# Altium schematic sheet NanoD1_Clk_Reset.SchDoc
size 420 x 297 mm; SheetNumber: 7; SheetTotal: 8
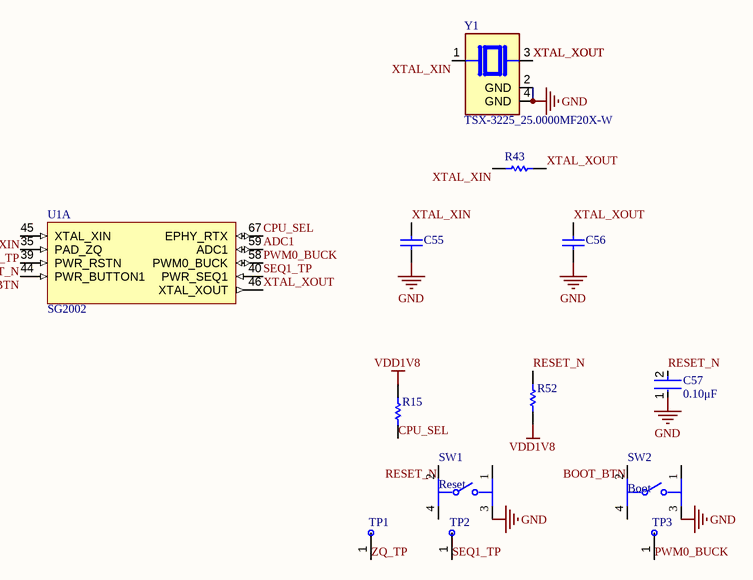
[diagram p0: NanoD1_Clk_Reset.SchDoc]

## Parts
C55  18pF  [CAPC1005X55X25LL05T10]  (value not drawn)
C56  18pF  [CAPC1005X55X25LL05T10]  (value not drawn)
C57  value 0.10μF  [FP-GRM15-MFG]  (hidden comment: 100nF)
R15  4.7K  [RESC1005X40X25ML05T10]  (value not drawn)
R43  1M  [RESC1005X40X25ML05T10]  (value not drawn)
R52  10K  [RESC1005X40X25ML05T10]  (value not drawn)
SW1  Reset  [FP-EVQ-P2002M-MFG]
SW2  Boot  [FP-EVQ-P2002M-MFG]
TP1  TP  [TP-1.5mm]  (value not drawn)
TP2  TP  [TP-1.5mm]  (value not drawn)
TP3  TP  [TP-1.5mm]  (value not drawn)
U1  SG2002  [QFN88-9x9-0.35]  (part A of 7)
Y1  TSX-3225_25.0000MF20X-W  [XTAL_TSX-3225_25.0000MF20X-W]

## Nets
GND: C55.1 C56.1 C57.1 SW1.3 SW2.3 Y1.2(GND) Y1.4(GND)
VDD1V8: R15.2 R52.1
ADC1: U1.59(ADC1)
BOOT_BTN: SW2.2 U1.44(PWR_BUTTON1)
CPU_SEL: R15.1 U1.67(EPHY_RTX)
PWM0_BUCK: TP3.1(TP) U1.58(PWM0_BUCK)
RESET_N: C57.2 R52.2 SW1.2 U1.39(PWR_RSTN)
SEQ1_TP: TP2.1(TP) U1.40(PWR_SEQ1)
XTAL_XIN: C55.2 R43.2 U1.45(XTAL_XIN) Y1.1
XTAL_XOUT: C56.2 R43.1 U1.46(XTAL_XOUT) Y1.3
ZQ_TP: TP1.1(TP) U1.35(PAD_ZQ)

Not connected (* = marked no-connect by the designer): SW1 1 4; SW2 1 4

## Notes on the sheet
- Type @ to refer to a designator
- (near R43) Type @ to refer to a designator
- THIS DOCUMENT AND THE DATA DISCLOSED HEREIN OR
- HEREWITH IS THE PROPERTY OF ALTIUM LIMITED AND MAY
- DWG NO:
- REVISION
- REV:
- DESCRIPTION
- DATE
- APPROVED
- BE FREELY DISTRIBUTED IN WHOLE. NO RIGHTS ARE
- RESERVED OR EXPRESS OR IMPLIED WARANTEE GIVEN.
- ENG:
- APPROVALS
- PROJECT
- DSN:
- CHK:
- REFERENCE DOCUMENTS
- PROJECT REVISION:
- TITLE
- DOCUMENT REVISION:
- DESIGN ITEM:
- BOM:
- FAB DWG:
- PCB DWG:
- ASSY DWG:
- SCALE:
- A3
- SIZE
- CAGE CODE
- FILE NAME
- DWG NO.
- SHEET
- OF
- REV

## Library data of the parts
C55 C56 = CMP-2008-03918-1: Part Number: GRM1555C1H180JA01D; Manufacturer: Murata
C57 = CMP-2100-03641-2: CAP CER 0.1UF 16V X7R 0402; Manufacturer Part Number: GRM155R71C104KA88D; Manufacturer: Murata; Standoff Height: 0mm; Tolerance: 10%; Voltage Rating: 16Vdc; Material: Ceramic; RoHS: TRUE; Temperature Characteristic: X7R; Octopart: https://octopart.com/grm155r71c104ka88d-murata-196880; Digikey Description: CAP CER 0.1UF 16V X7R 0402; Device Class L3: Ceramic Capacitors; Height: 0.55mm; ComponentLink2Description: Datasheet; Temperature Range Low: -55°C; Ipc Land Pattern Name: CAPC10050X219; ComponentLink2URL: https://search.murata.co.jp/Ceramy/image/img/A01X/G101/ENG/GRM155R71H471KA01-01A.pdf; Device Class L1: Passive Components; Lead Free: yes; Category: Cap; Package: GRM15; Temperature: -55°C to +125°C; Device Class L2: Capacitors; Capacitance: 0.10μF; Temperature Range High: +125°C; Mouser Description: 0402 0.1 uF 16V ±10 % Tolerance X7R SMT Multilayer Ceramic Capacitor
R15 = CMP-1011-00586-2: Manufacturer: Yageo / Phycomp; Part Number: RC0402FR-074K7L
R43 = CMP-2002-07490-1: Manufacturer: Yageo / Phycomp; Part Number: RC0402FR-071ML
R52 = CMP-2002-07353-1: Part Number: RC0402FR-0710KL; Manufacturer: Yageo / Phycomp
SW1 SW2 = CMP-00287-40010164-1: EVQ-P2002M Switch Tactile N.O. SPST Button J-Bend 0.02A 15VDC 1N SMD Automotive Embossed T/R; Mechanical Life: 1Mcycles; Voltage Rating (DC): 15V; Contact Resistance: 100mΩ; Illumination Type: Illuminated, Non-Illuminated; Actuator Length: 450µm; Number of Positions: 2; Current Rating: 20mA; Switch Function: Off-Mom; Switch Travel: 250µm; Electrical Life: 1Mcycles; Lead Free: Lead Free; Mount: Surface Mount; Max Voltage Rating (DC): 15V; Termination: J-Bend; Max Operating Temperature: 85°C; Throw Configuration: SPST; Height: 2.3mm; Contact Current Rating: 20mA; Radiation Hardening: No; Min Operating Temperature: -40°C; NexarPartId: 40010164; Orientation: Straight; RoHS: Compliant; Operating Force: 1N; Life (Cycles): 1Mcycles; REACH SVHC: No SVHC
TP1-TP3 = TestPoint: Test point, 1.5 mm exposed pad
U1 = SG2002: RISC-V C906 / Cortex-A53 SoC, 256MB DDR3 SiP, QFN88 9x9 0.35mm
Y1 = TSX-3225_25.0000MF20X-W: MF: {'manufacturer': u'Epson Timing'}; MP: TSX-3225 25.0000MF20X-W; Package: None; Price: None; Value: *; Availability: Unavailable